# Altium schematic sheet Altium_Schematic.schdoc (part 1 of 6)
size 1187 x 839 mm; Symbol: Drawing-Symbol_A4; @Project Name: LumaTilt; @Page Count: 1; @Update Date: 2026-10-28; @Create Date: 2026-10-28; @Schematic Name: Schematic1; @Page No: 1; @Page Name: P1; Company: EasyEDA.com; Version: V1.0; Page Size: A4; Device: Drawing-Symbol_A4; @Create Time: 13:19:37; @Update Time: 13:19:37; Border: 1; Width: 4676; Height: 3304; Region Start: 1; X Region Count: 6; Y Region Count: 4; Blade Width: 10; Title Block Position: 3; @Board Name: Board1
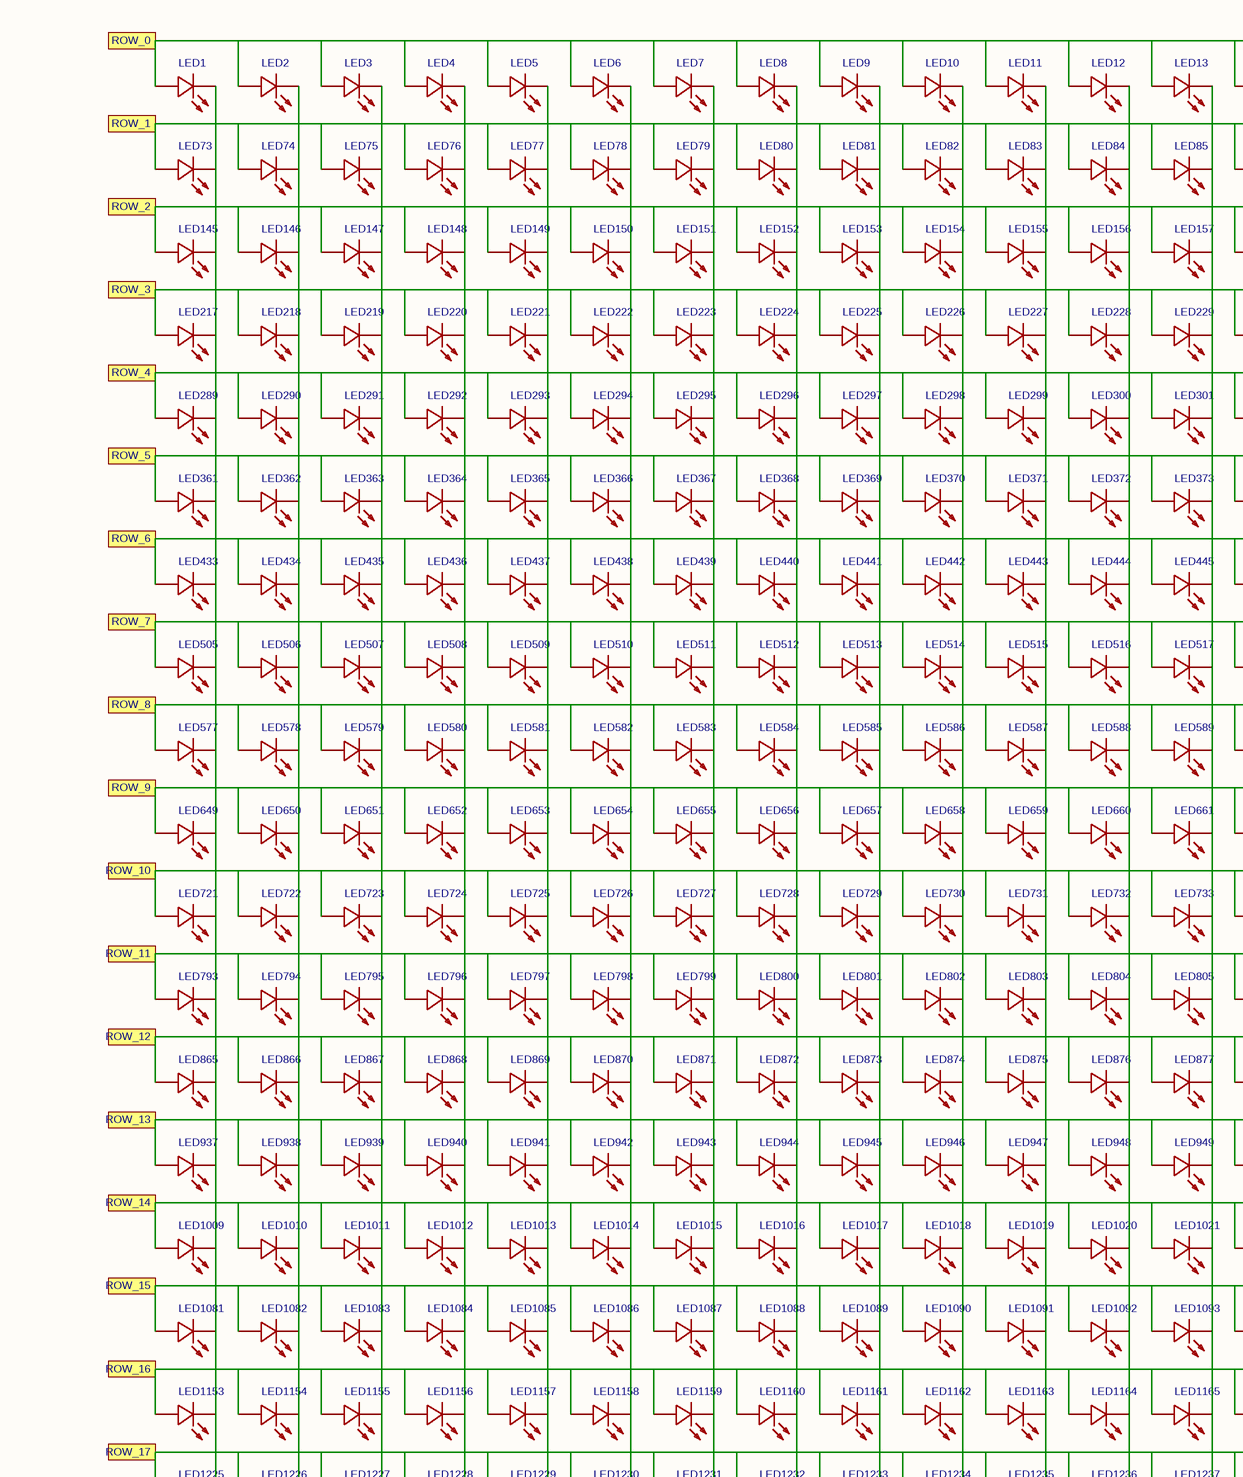
[diagram p0: Altium_Schematic.schdoc, top column 1 of 4]
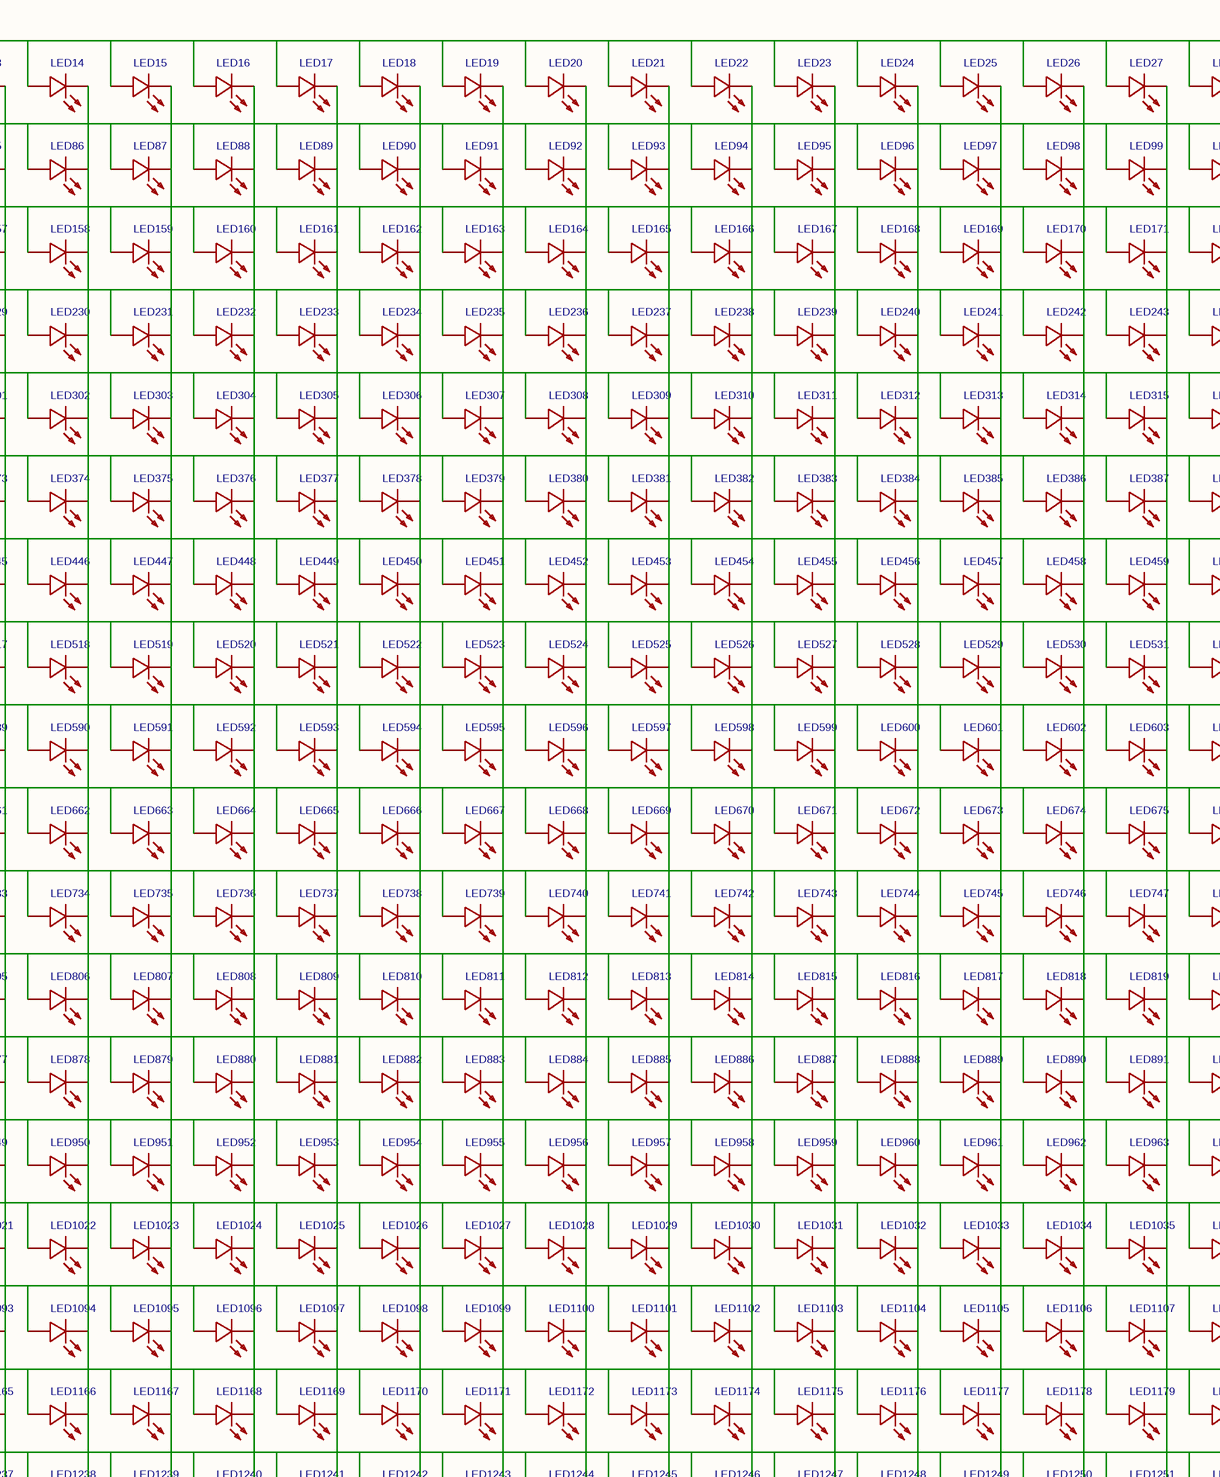
[diagram p1: Altium_Schematic.schdoc, top column 2 of 4]
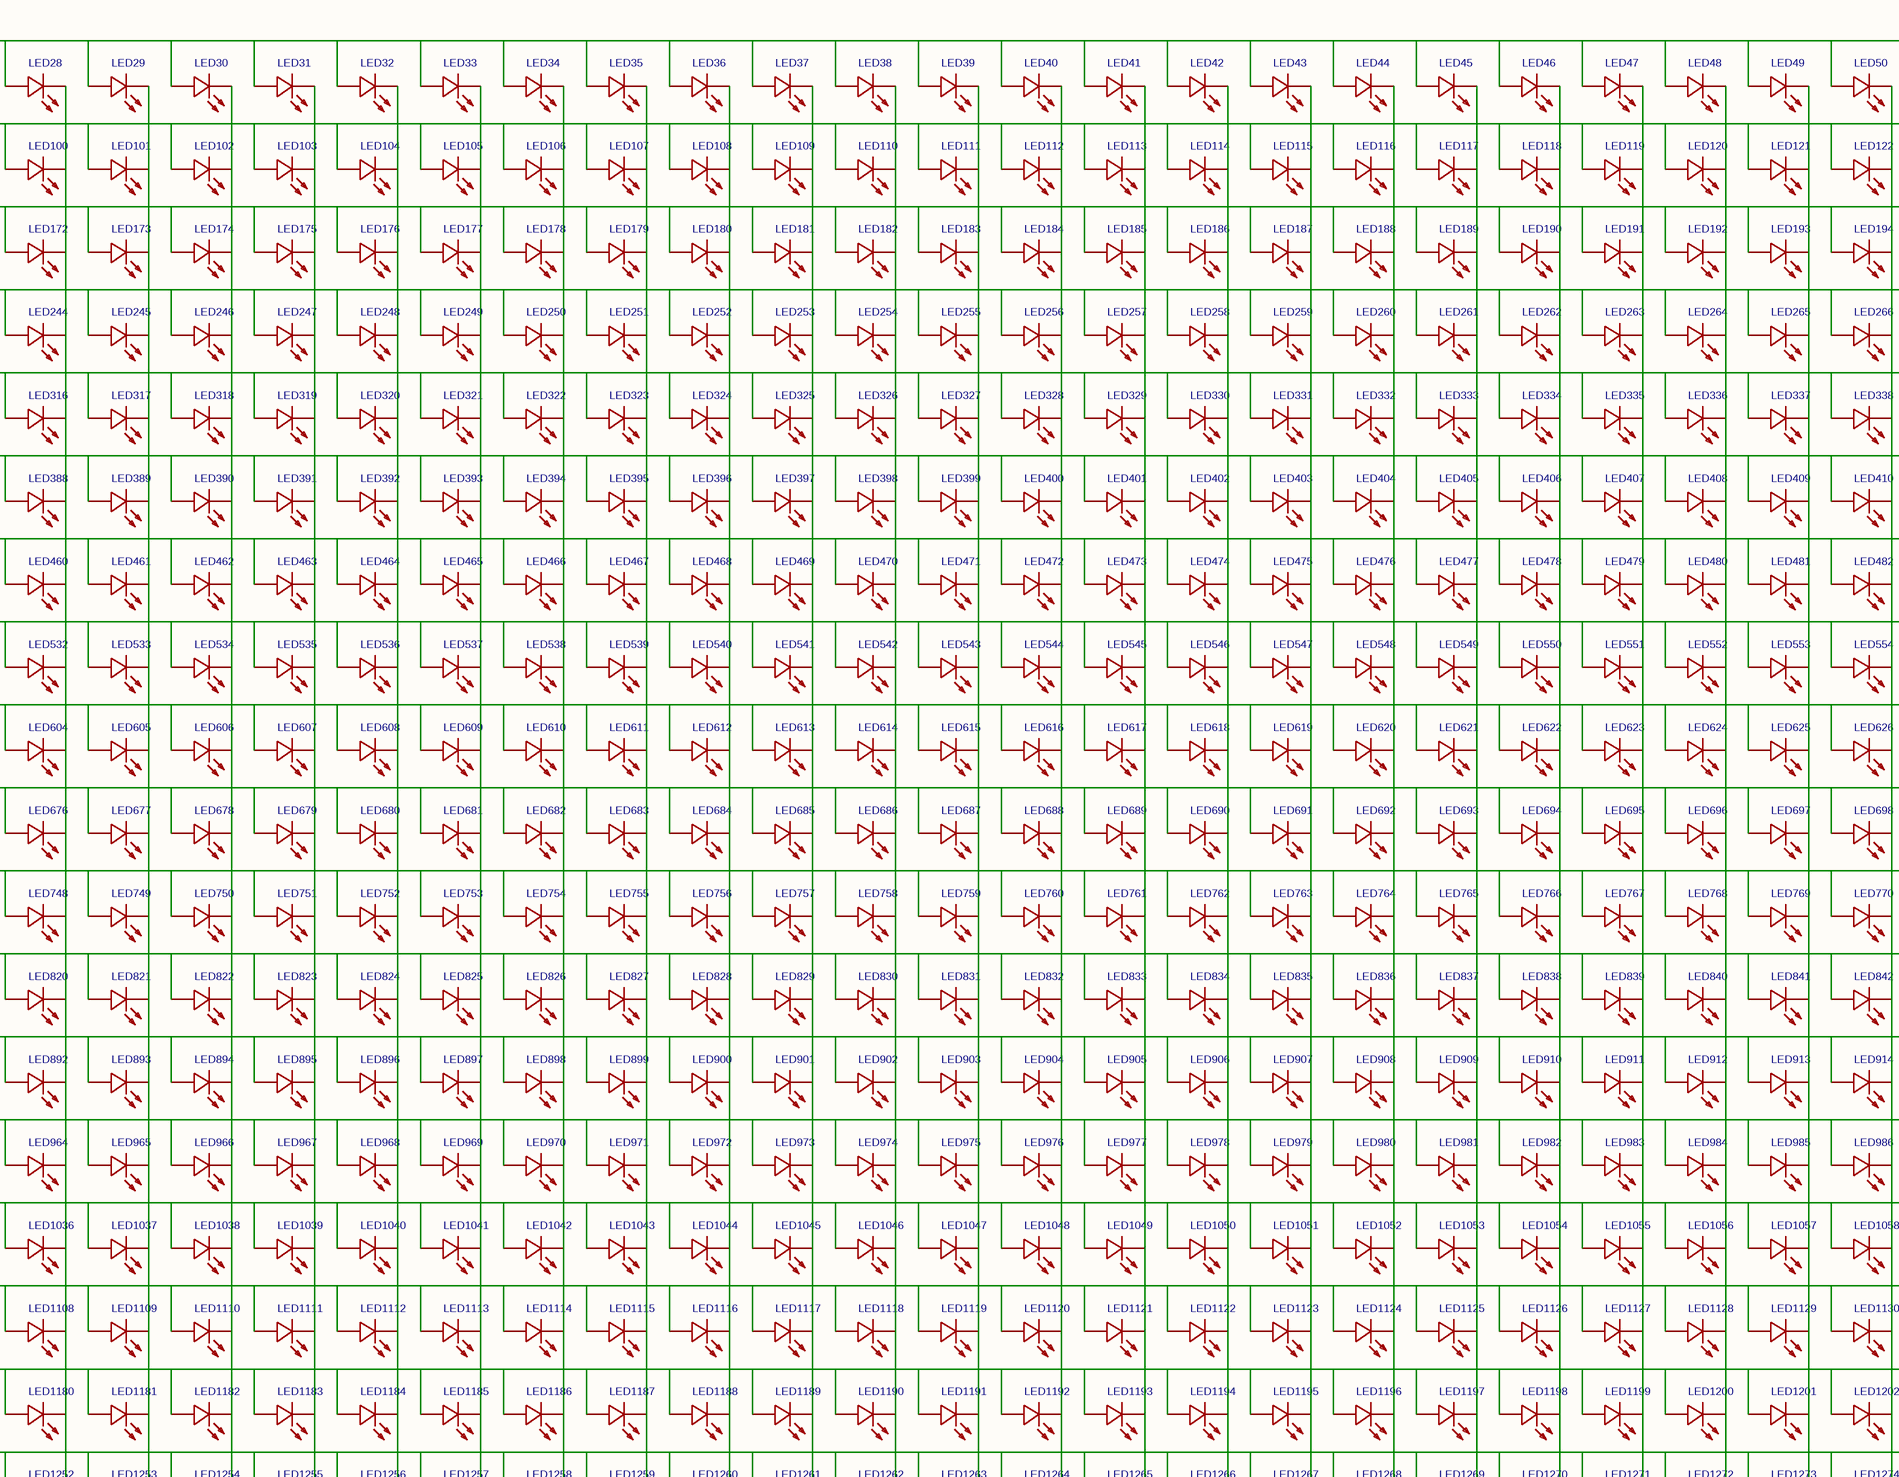
[diagram p2: Altium_Schematic.schdoc, top column 3 of 4]
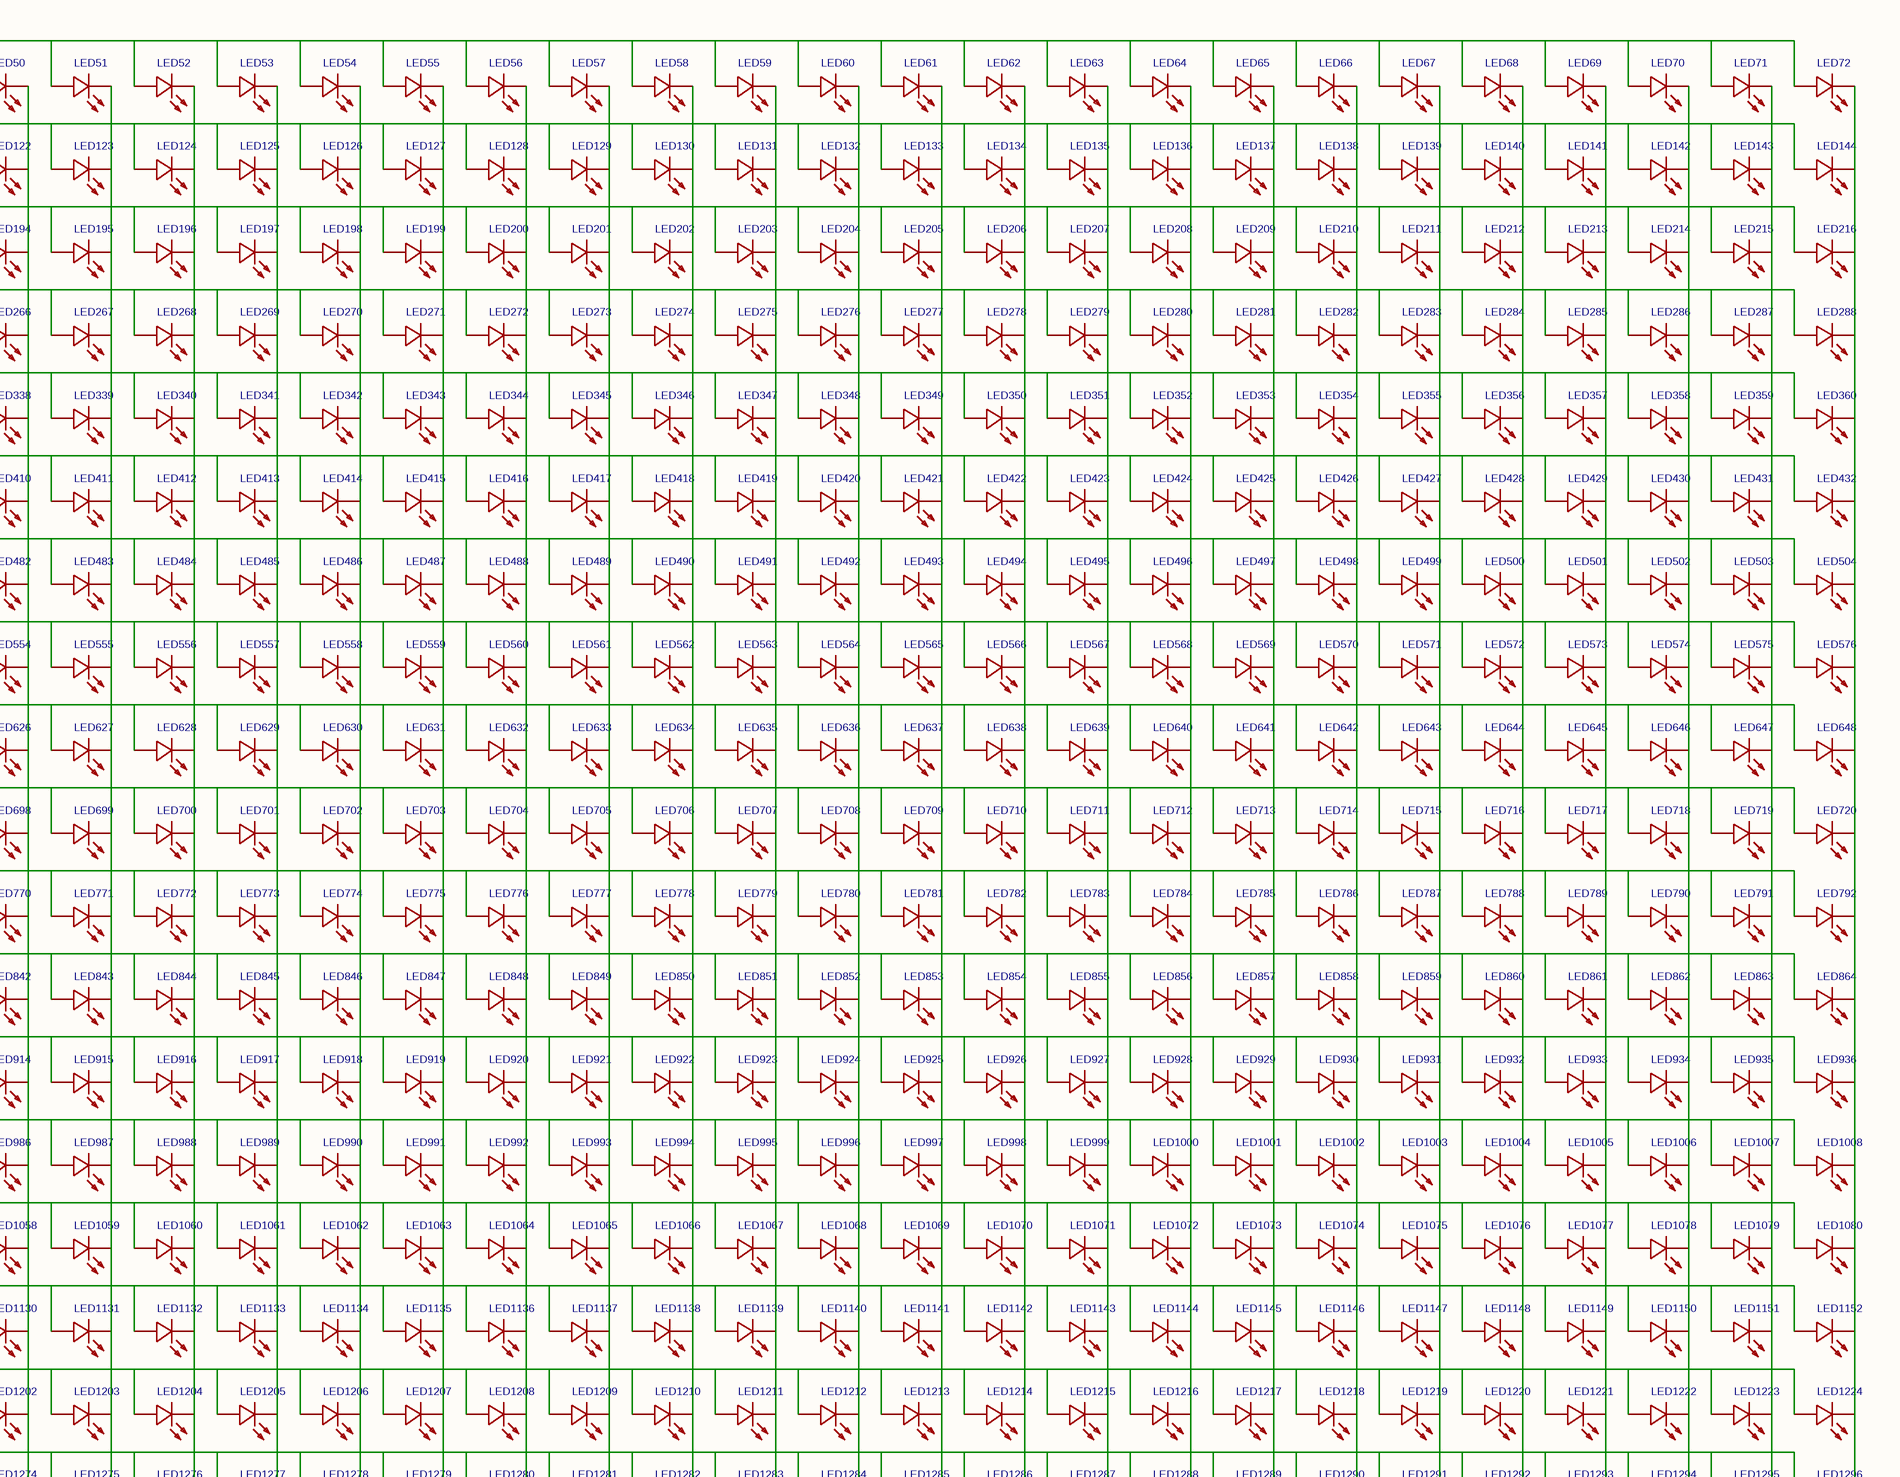
[diagram p3: Altium_Schematic.schdoc, top column 4 of 4]
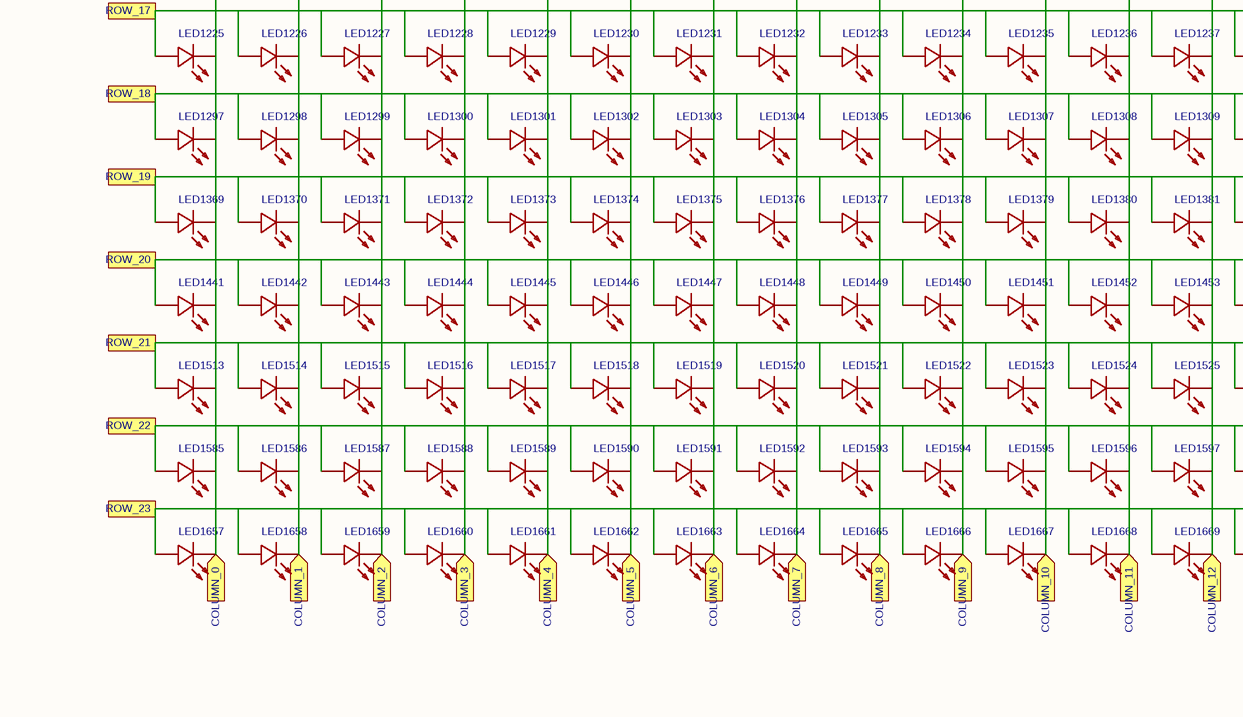
[diagram p4: Altium_Schematic.schdoc, centre column 1 of 4]
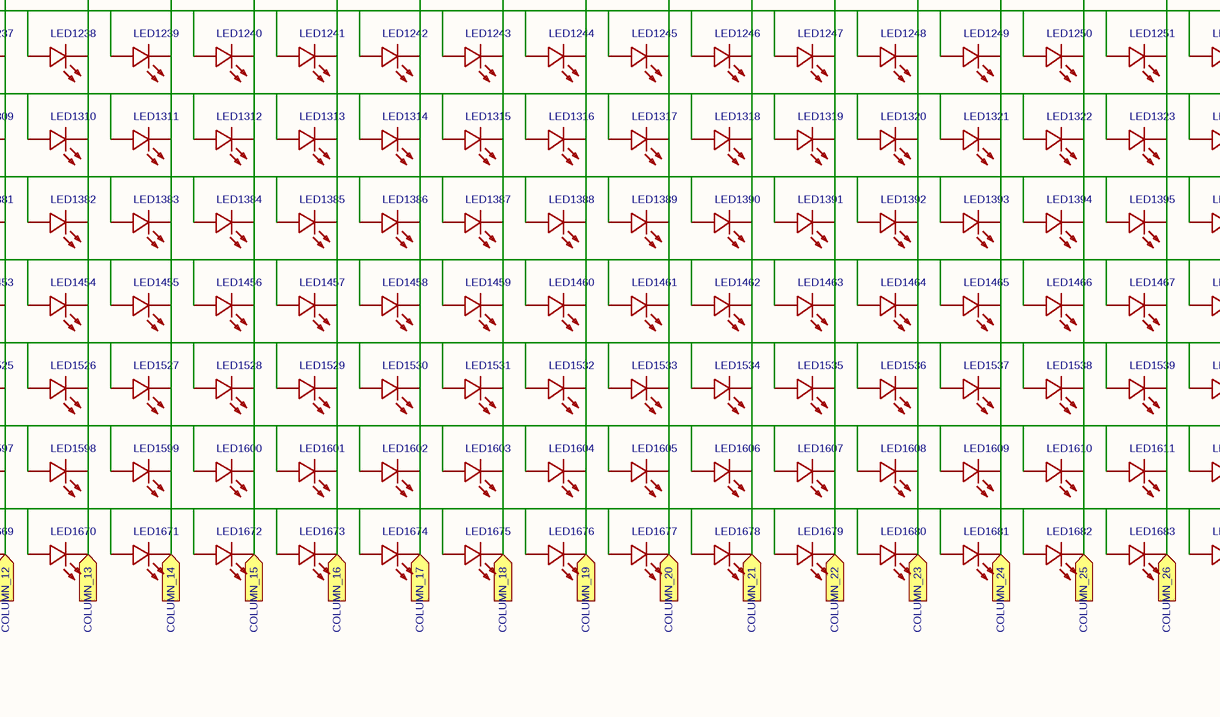
[diagram p5: Altium_Schematic.schdoc, centre column 2 of 4]
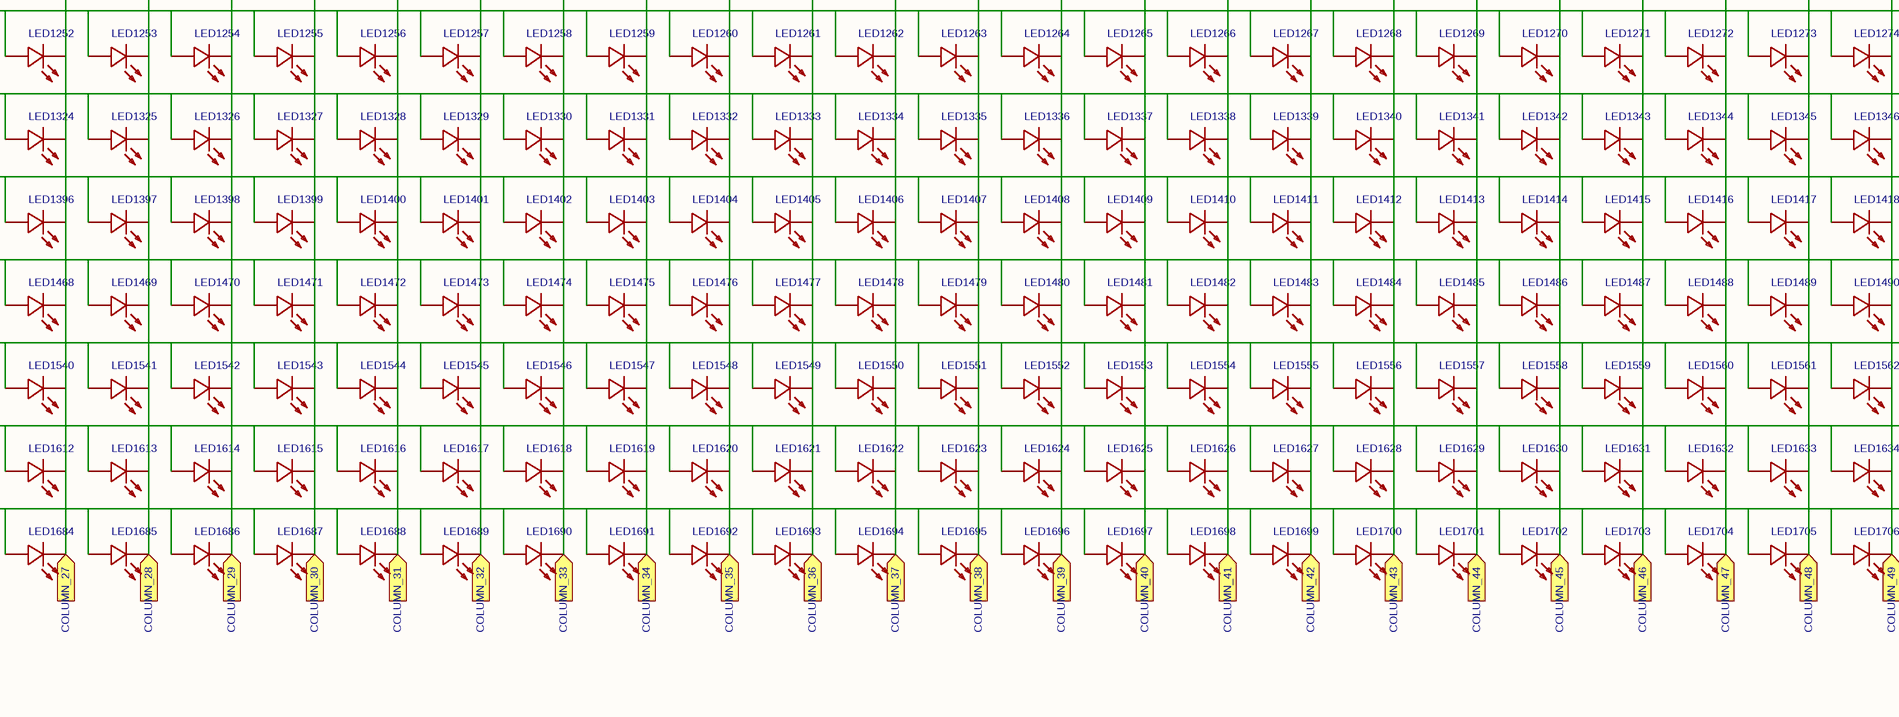
[diagram p6: Altium_Schematic.schdoc, centre column 3 of 4]
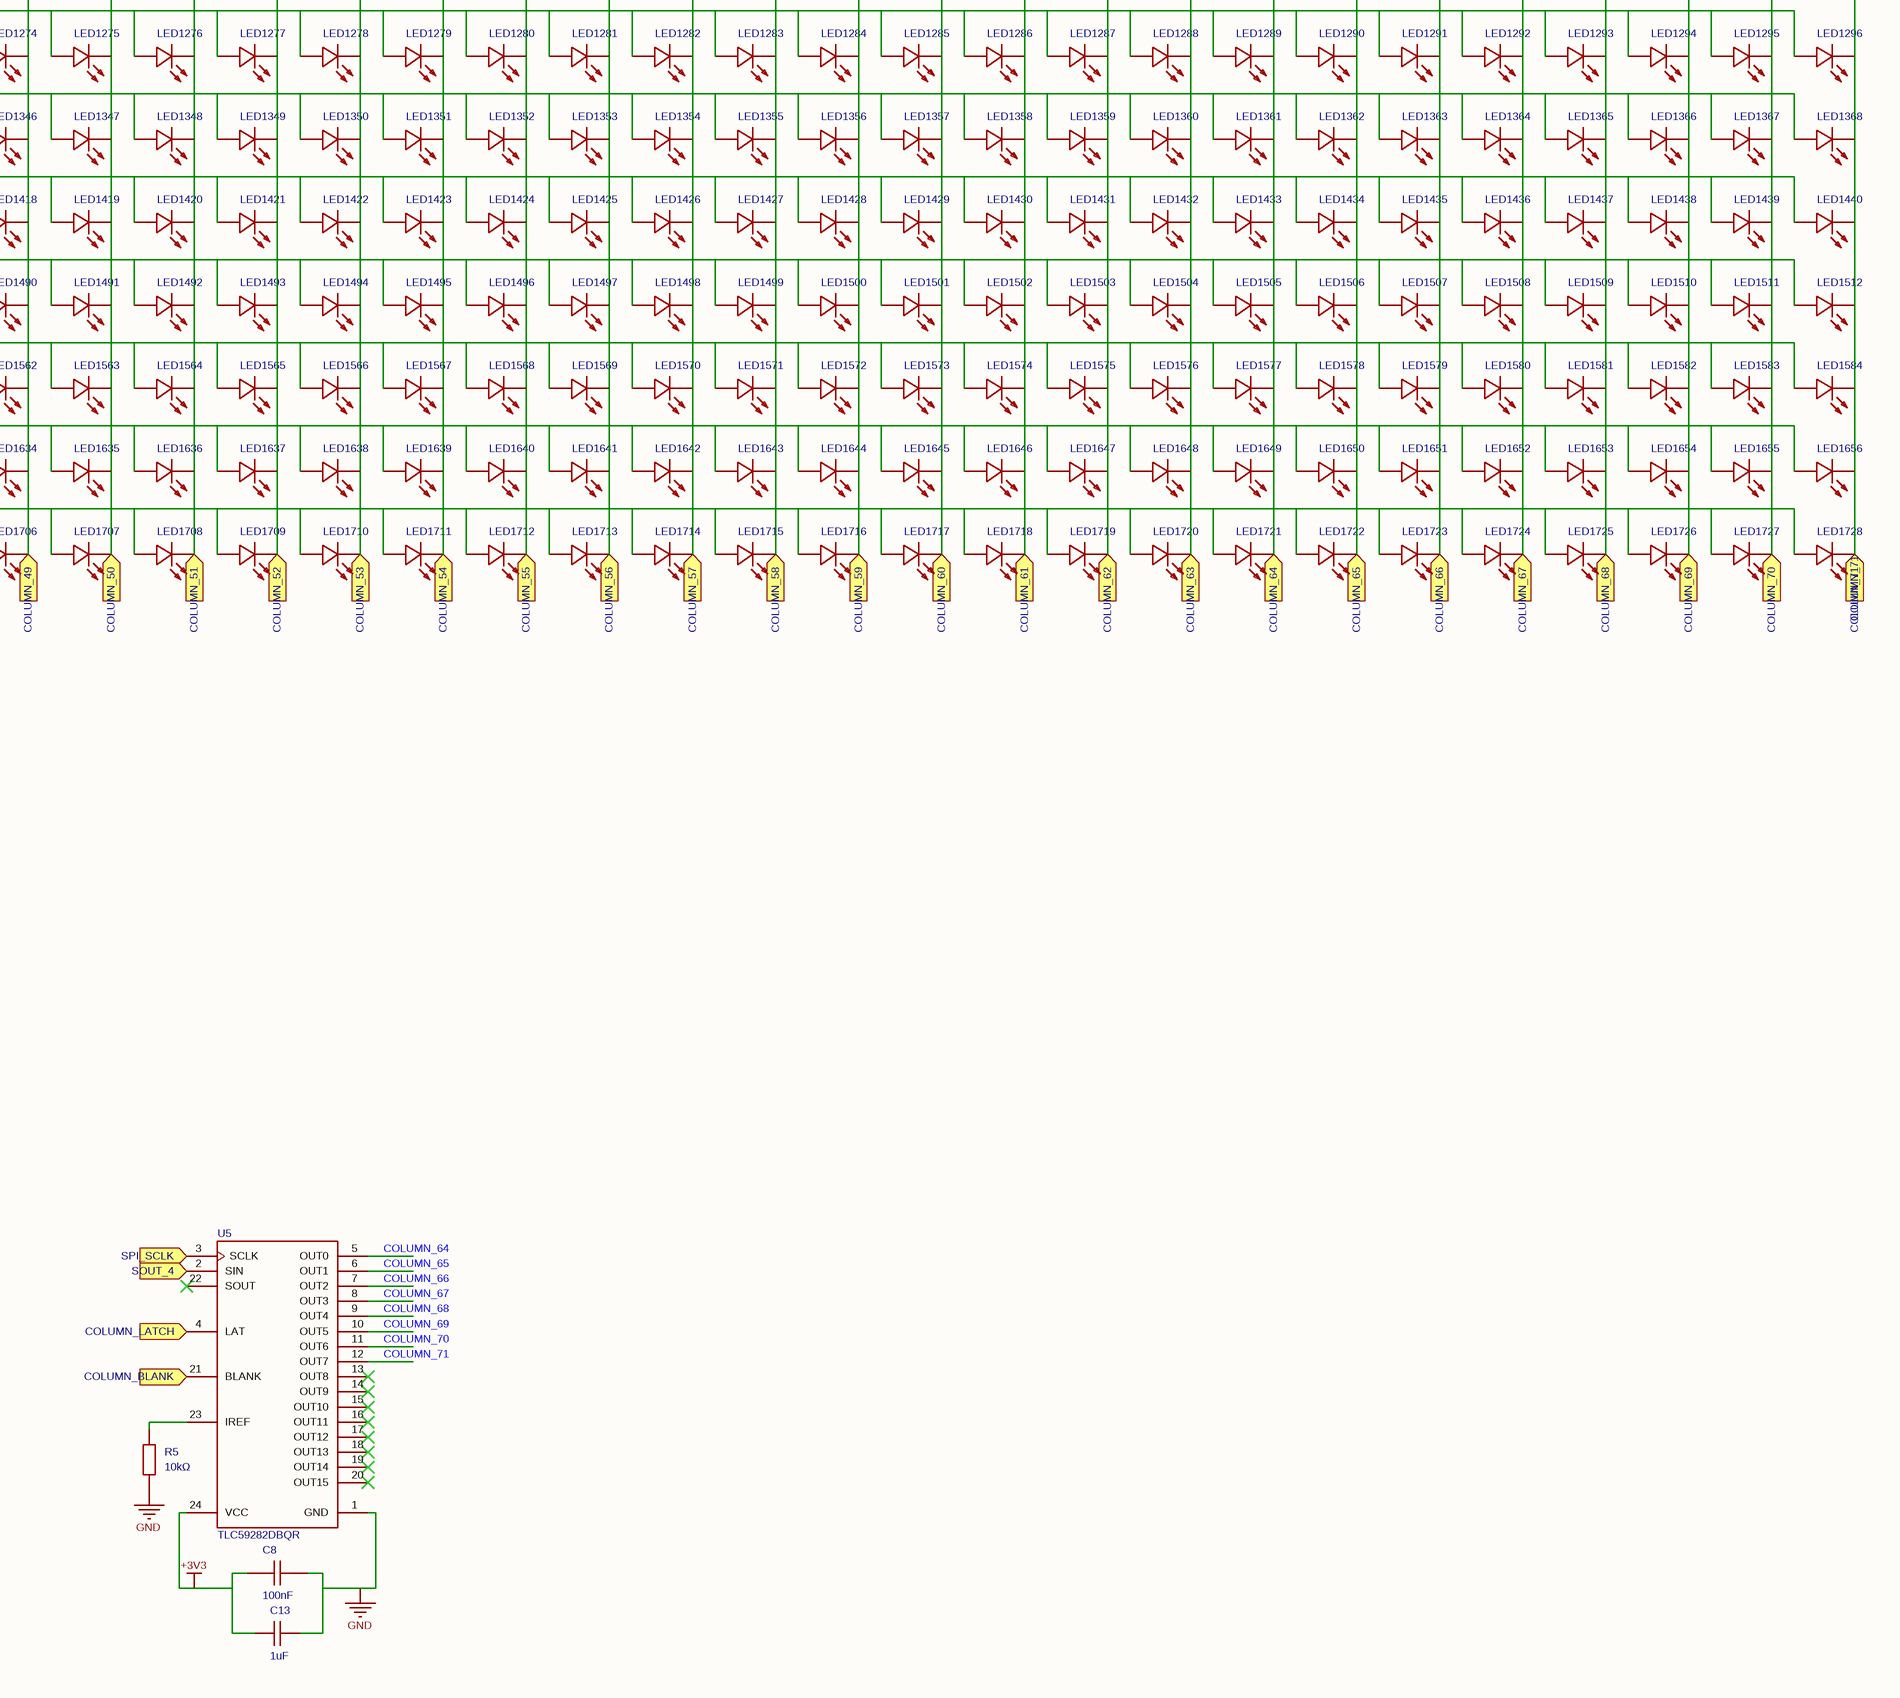
[diagram p7: Altium_Schematic.schdoc, centre column 4 of 4]
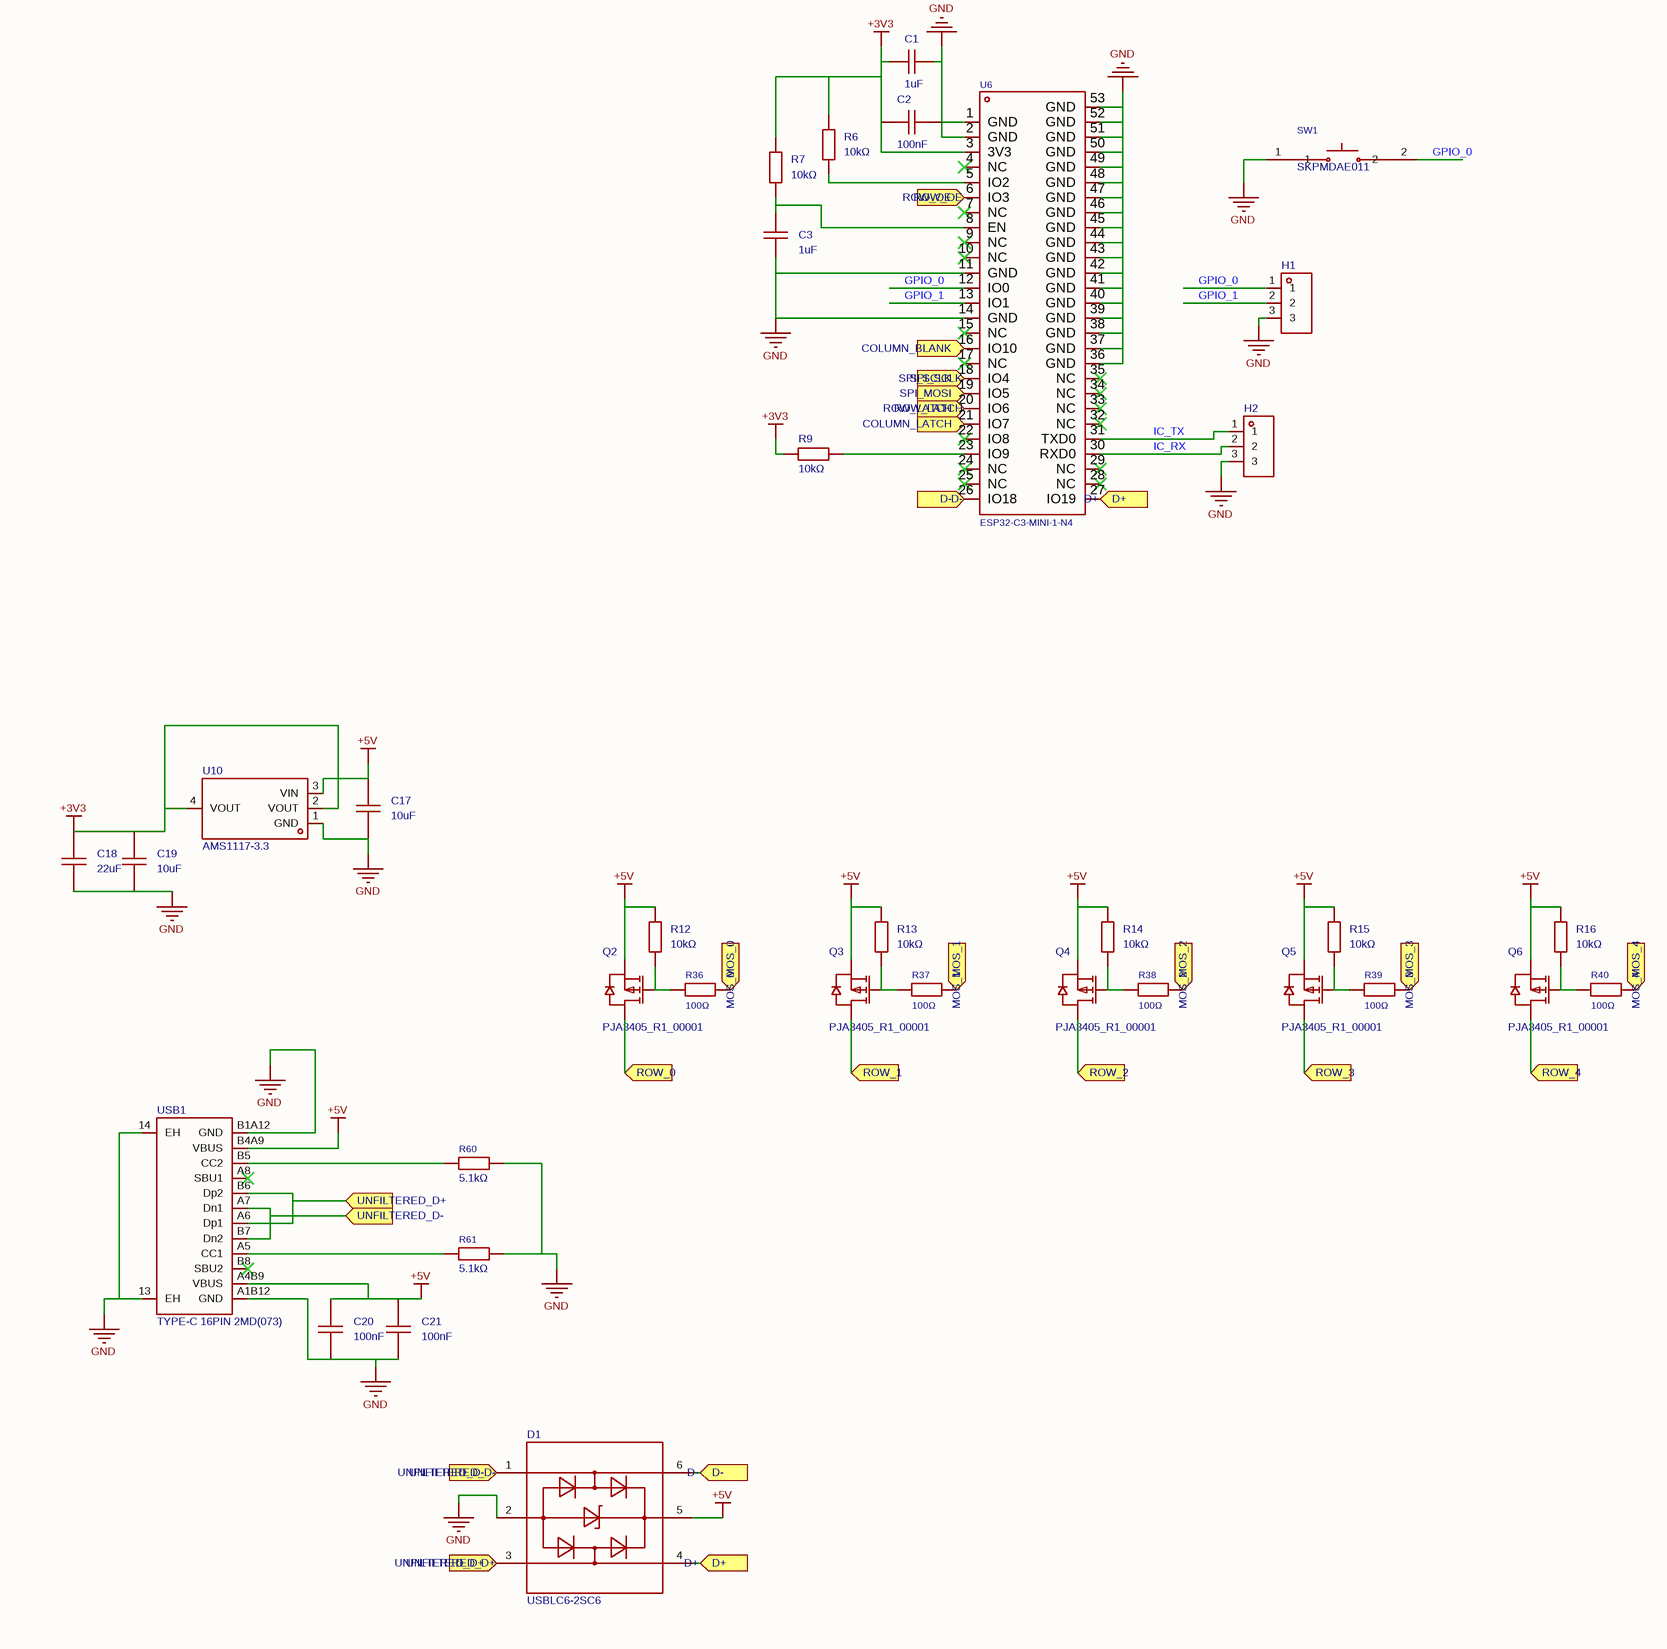
[diagram p8: Altium_Schematic.schdoc, bottom column 1 of 4]
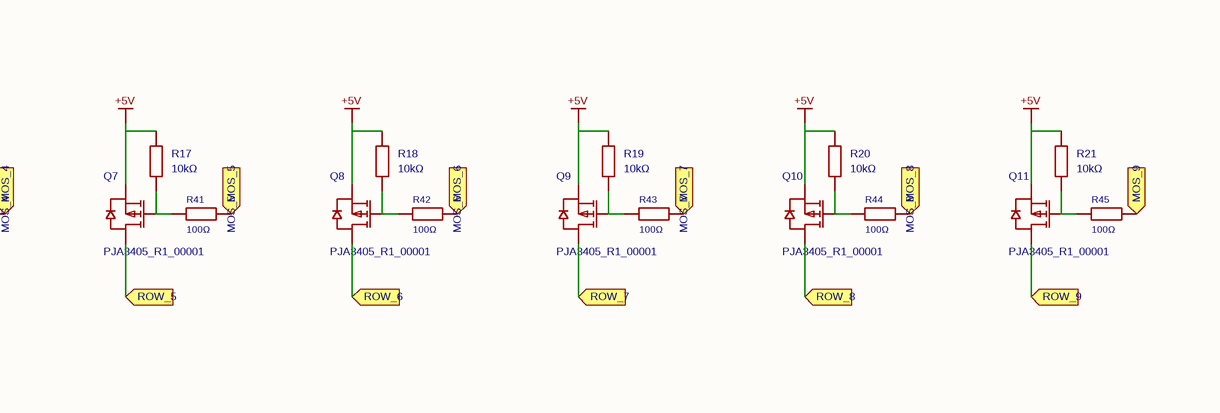
[diagram p9: Altium_Schematic.schdoc, bottom column 2 of 4]
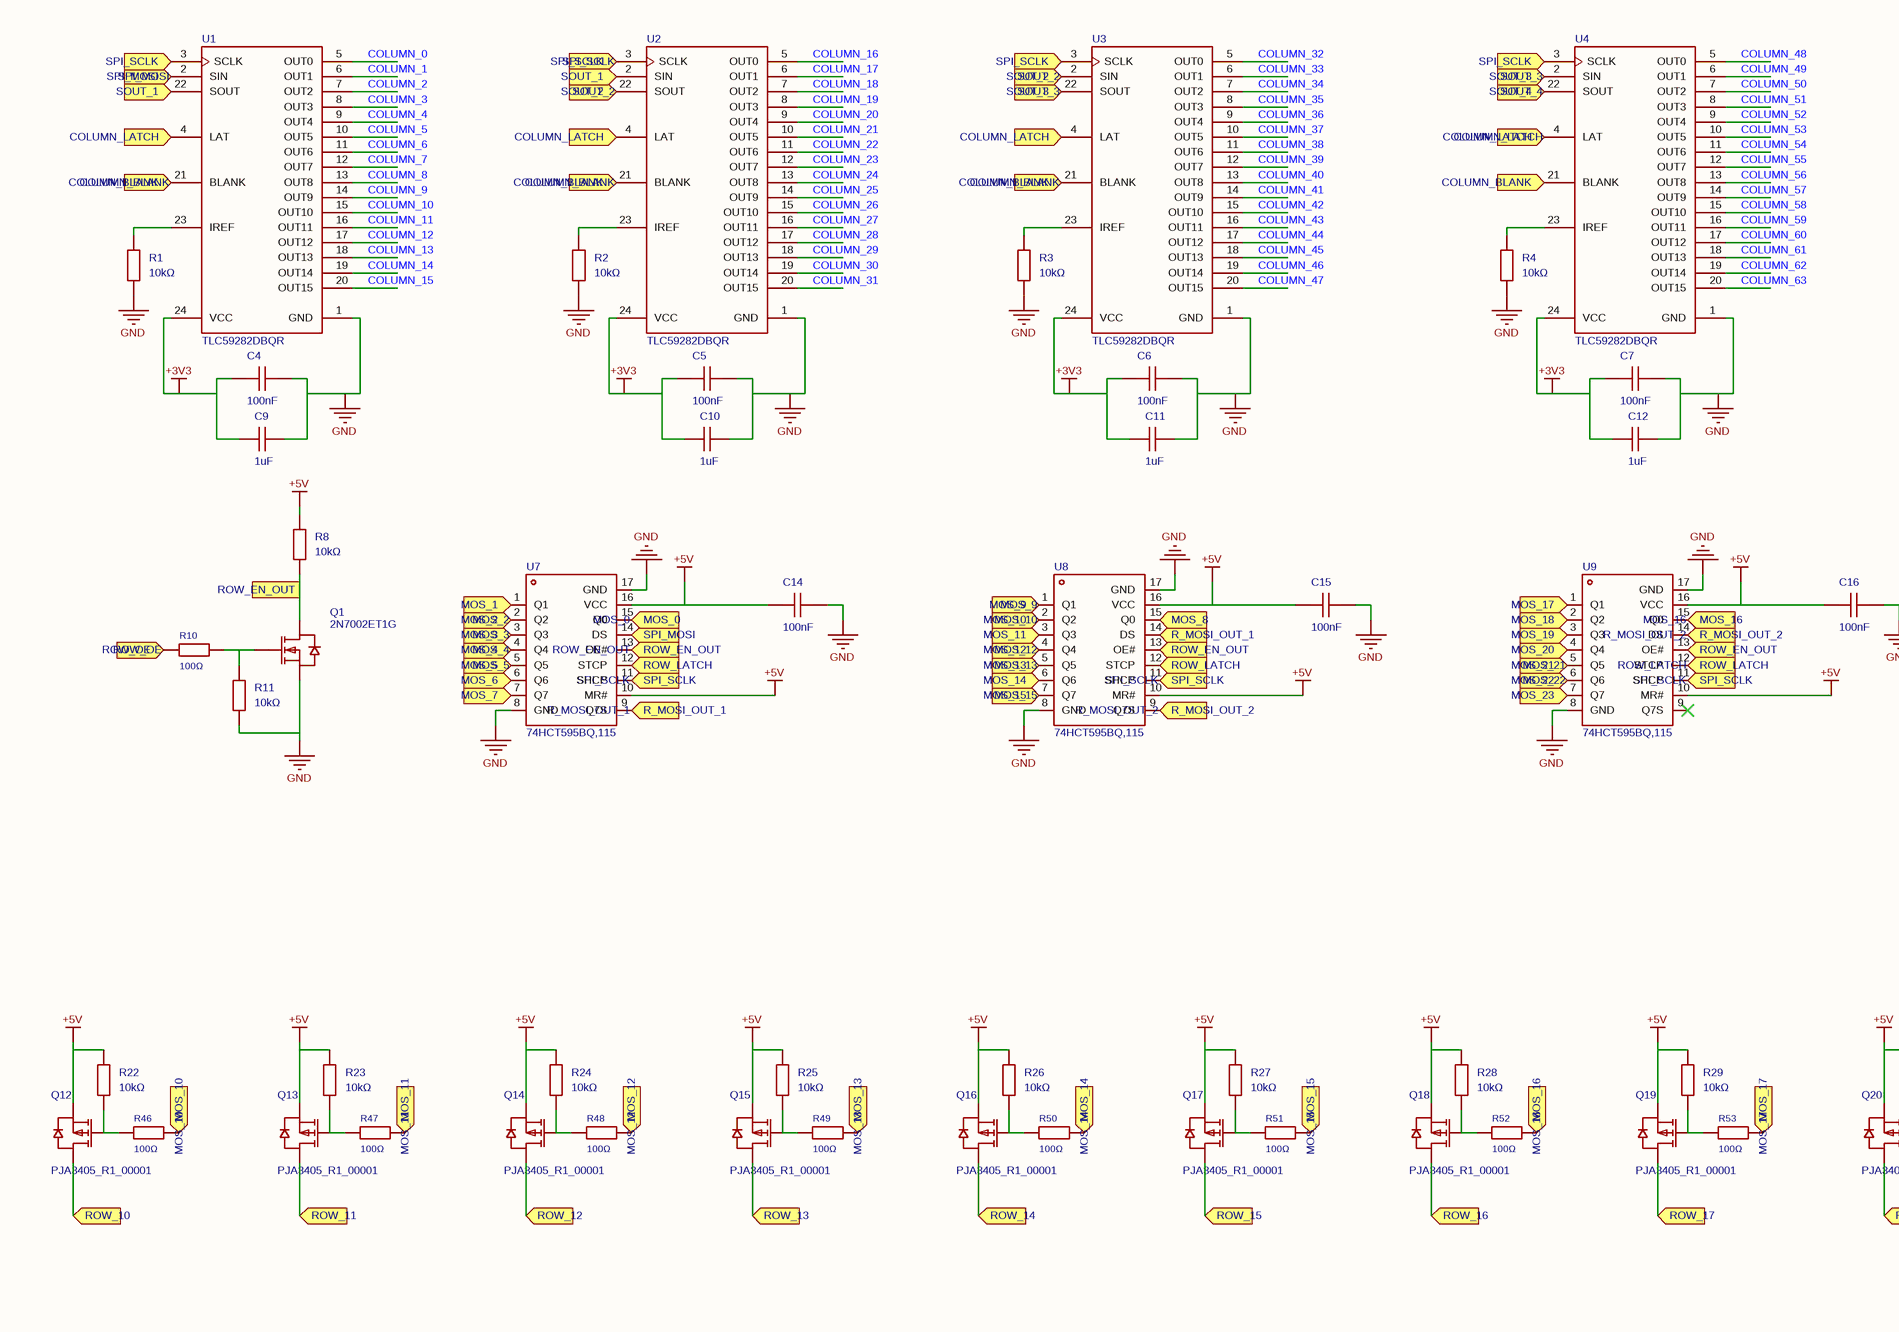
[diagram p10: Altium_Schematic.schdoc, bottom column 3 of 4]
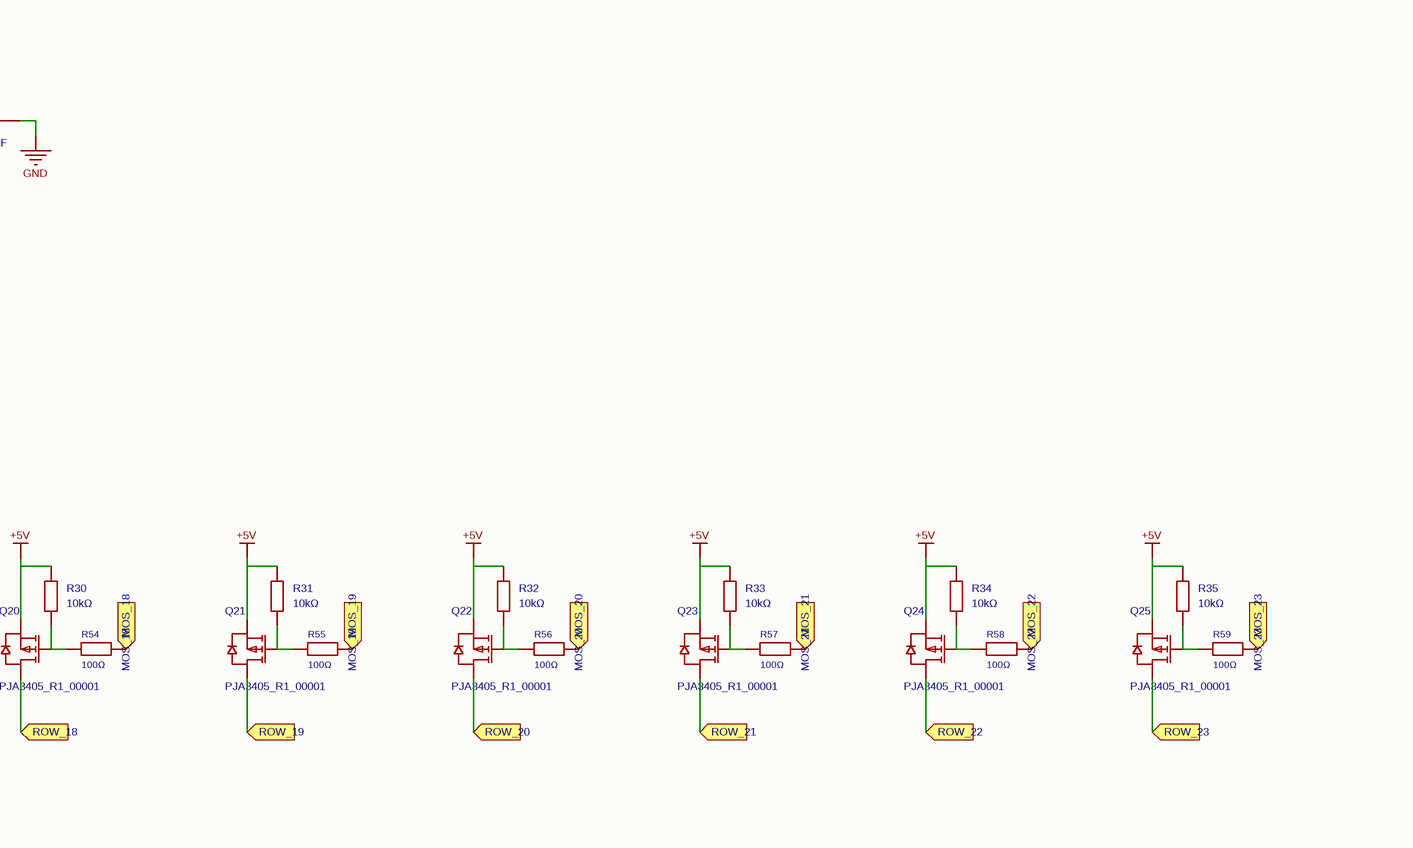
[diagram p11: Altium_Schematic.schdoc, bottom column 4 of 4]